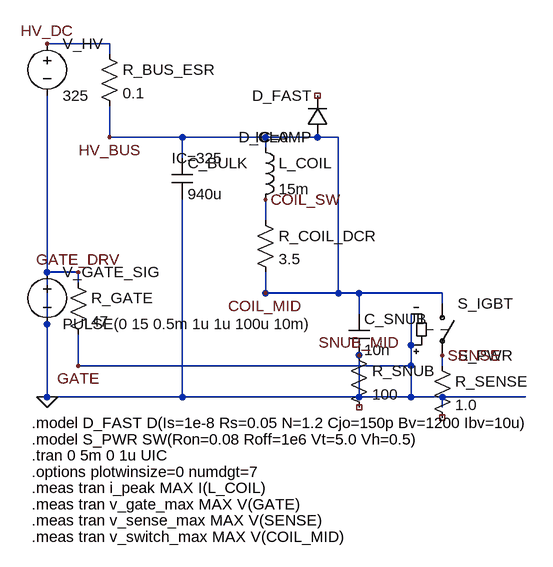
[diagram p0: schematic test_perfect_emc100.asc]
test_perfect_emc100.asc, the LTspice schematic file:
Version 4
SHEET 1 1280 800
WIRE 64 16 160 16
WIRE 160 16 160 32
WIRE 160 112 160 160
WIRE 160 160 272 160
WIRE 272 160 400 160
WIRE 272 160 272 192
WIRE 272 256 272 560
WIRE 64 96 64 560
WIRE 64 560 272 560
WIRE 272 560 544 560
WIRE 544 560 672 560
WIRE 672 560 800 560
WIRE 400 160 400 176
WIRE 400 256 400 288
WIRE 400 368 400 400
WIRE 400 400 544 400
WIRE 544 400 544 432
WIRE 544 496 544 560
WIRE 400 400 672 400
WIRE 672 400 672 416
WIRE 672 496 672 512
WIRE 672 576 672 560
WIRE 400 400 512 400
WIRE 512 400 512 160
WIRE 512 160 400 160
WIRE 64 368 112 368
WIRE 112 368 112 384
WIRE 112 464 112 512
WIRE 112 512 624 512
WIRE 624 512 624 480
WIRE 64 448 64 560
WIRE 624 432 624 448
WIRE 624 448 624 560
FLAG 64 560 0
FLAG 64 16 HV_DC
FLAG 160 160 HV_BUS
FLAG 400 256 COIL_SW
FLAG 400 400 COIL_MID
FLAG 112 368 GATE_DRV
FLAG 112 512 GATE
FLAG 672 496 SENSE
FLAG 544 496 SNUB_MID
SYMBOL voltage 64 0 R0
WINDOW 123 0 0 Left 2
WINDOW 39 0 0 Left 2
SYMATTR InstName V_HV
SYMATTR Value 325
SYMBOL res 144 16 R0
WINDOW 123 0 0 Left 2
WINDOW 39 0 0 Left 2
SYMATTR InstName R_BUS_ESR
SYMATTR Value 0.1
SYMBOL cap 256 192 R0
WINDOW 123 0 0 Left 2
WINDOW 39 0 0 Left 2
SYMATTR InstName C_BULK
SYMATTR Value 940u
SYMATTR SpiceLine IC=325
SYMBOL ind 384 160 R0
WINDOW 123 0 0 Left 2
WINDOW 39 0 0 Left 2
SYMATTR InstName L_COIL
SYMATTR Value 15m
SYMATTR SpiceLine IC=0
SYMBOL res 384 272 R0
WINDOW 123 0 0 Left 2
WINDOW 39 0 0 Left 2
SYMATTR InstName R_COIL_DCR
SYMATTR Value 3.5
SYMBOL diode 496 160 R180
WINDOW 123 0 0 Left 2
WINDOW 39 0 0 Left 2
SYMATTR InstName D_CLAMP
SYMATTR Value D_FAST
SYMBOL cap 528 432 R0
WINDOW 123 0 0 Left 2
WINDOW 39 0 0 Left 2
SYMATTR InstName C_SNUB
SYMATTR Value 10n
SYMBOL res 528 480 R0
WINDOW 123 0 0 Left 2
WINDOW 39 0 0 Left 2
SYMATTR InstName R_SNUB
SYMATTR Value 100
SYMBOL sw 672 400 R0
WINDOW 123 0 0 Left 2
WINDOW 39 0 0 Left 2
SYMATTR InstName S_IGBT
SYMATTR Value S_PWR
SYMBOL res 656 496 R0
WINDOW 123 0 0 Left 2
WINDOW 39 0 0 Left 2
SYMATTR InstName R_SENSE
SYMATTR Value 1.0
SYMBOL voltage 64 352 R0
WINDOW 123 0 0 Left 2
WINDOW 39 0 0 Left 2
SYMATTR InstName V_GATE_SIG
SYMATTR Value PULSE(0 15 0.5m 1u 1u 100u 10m)
SYMBOL res 96 368 R0
WINDOW 123 0 0 Left 2
WINDOW 39 0 0 Left 2
SYMATTR InstName R_GATE
SYMATTR Value 47
TEXT 40 600 Left 2 !.model D_FAST D(Is=1e-8 Rs=0.05 N=1.2 Cjo=150p Bv=1200 Ibv=10u)
TEXT 40 625 Left 2 !.model S_PWR SW(Ron=0.08 Roff=1e6 Vt=5.0 Vh=0.5)
TEXT 40 650 Left 2 !.tran 0 5m 0 1u UIC
TEXT 40 675 Left 2 !.options plotwinsize=0 numdgt=7
TEXT 40 700 Left 2 !.meas tran i_peak MAX I(L_COIL)
TEXT 40 725 Left 2 !.meas tran v_gate_max MAX V(GATE)
TEXT 40 750 Left 2 !.meas tran v_sense_max MAX V(SENSE)
TEXT 40 775 Left 2 !.meas tran v_switch_max MAX V(COIL_MID)

The netlist it stands for:
* test_perfect_emc100.asc
V_HV HV_DC 0 325
R_BUS_ESR HV_DC COIL_MID 0.1
C_BULK COIL_MID 0 940u IC=325
L_COIL COIL_MID COIL_SW 15m IC=0
R_COIL_DCR COIL_SW COIL_MID 3.5
D_CLAMP COIL_MID NC_01 D_FAST
C_SNUB COIL_MID 0 10n
R_SNUB 0 NC_02 100
S_IGBT COIL_MID SENSE 0 0 S_PWR
R_SENSE SENSE NC_03 1.0
V_GATE_SIG 0 0 PULSE(0 15 0.5m 1u 1u 100u 10m)
R_GATE 0 0 47
.model D D
.lib standard.dio
.model D_FAST D(Is=1e-8 Rs=0.05 N=1.2 Cjo=150p Bv=1200 Ibv=10u)
.model S_PWR SW(Ron=0.08 Roff=1e6 Vt=5.0 Vh=0.5)
.tran 0 5m 0 1u UIC
.options plotwinsize=0 numdgt=7
.meas tran i_peak MAX I(L_COIL)
.meas tran v_gate_max MAX V(GATE)
.meas tran v_sense_max MAX V(SENSE)
.meas tran v_switch_max MAX V(COIL_MID)
.backanno
.end